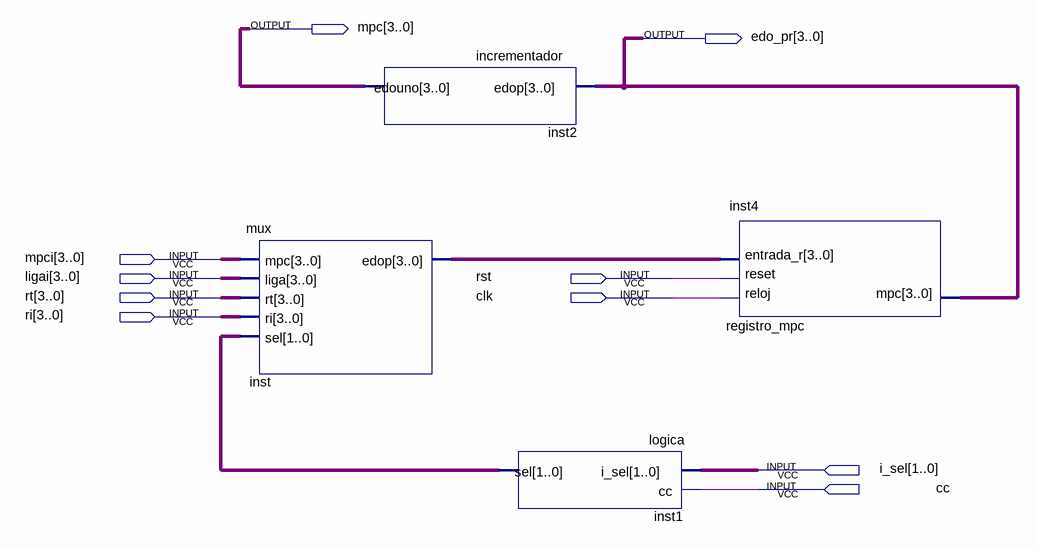
[diagram p0: schematic sheet]
// Quartus schematic secuenciador.bdf as structural Verilog: 4 symbols, 10 pins
module secuenciador (
  input  [3:0] mpci,
  input  [3:0] ligai,
  input  rst,
  input  [3:0] rt,
  input  clk,
  input  [3:0] ri,
  input  [1:0] i_sel,
  input  cc,
  output [3:0] mpc,
  output [3:0] edo_pr
);

  wire [1:0] inst1_sel;
  wire [3:0] inst_edop;

  mux inst (.mpc(mpci), .liga(ligai), .rt(rt), .ri(ri), .sel(inst1_sel), .edop(inst_edop));
  incrementador inst2 (.edop(edo_pr), .edouno(mpc));
  logica inst1 (.i_sel(i_sel), .cc(cc), .sel(inst1_sel));
  registro_mpc inst4 (.reloj(clk), .reset(rst), .entrada_r(inst_edop), .mpc(edo_pr));
endmodule
